# Altium schematic sheet 60_HOST_UART.SchDoc
size 209 x 148 mm
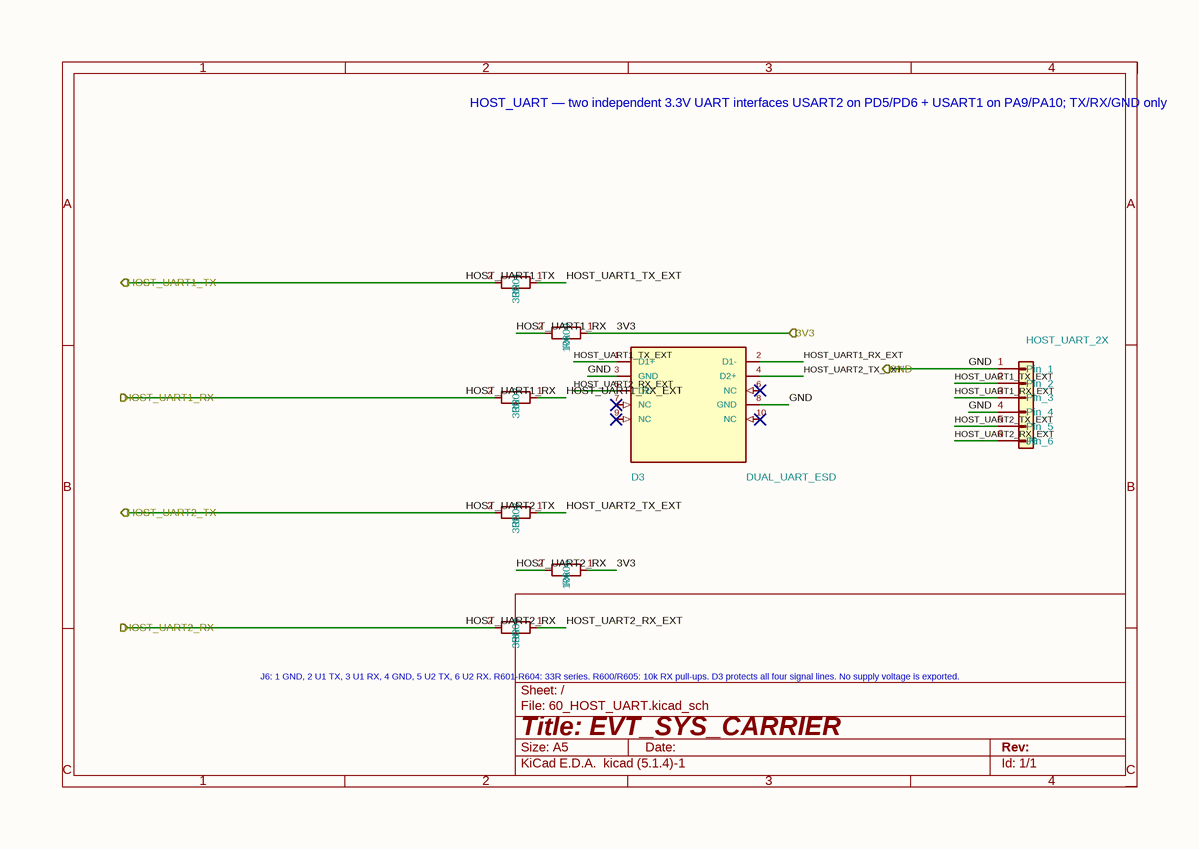
[diagram p0: 60_HOST_UART.SchDoc]

## Parts
D3  DUAL_UART_ESD  [USON-10_2.5x1.0mm_P0.5mm]
J6  HOST_UART_2X  [Molex_43045-0600_RA_THT_6P]
R600  10k  [R_0603_1608Metric]
R601  33R  [R_0402_1005Metric]
R602  33R  [R_0402_1005Metric]
R603  33R  [R_0402_1005Metric]
R604  33R  [R_0402_1005Metric]
R605  10k  [R_0603_1608Metric]

## Ports
3V3 (in), GND, HOST_UART1_RX (out), HOST_UART1_TX (in), HOST_UART2_RX (out), HOST_UART2_TX (in)

## Nets
3V3: R600.1 R605.1 ; port 3V3
GND: D3.3(GND) D3.8(GND) J6.1(Pin_1) J6.4(Pin_4) ; port GND
HOST_UART1_RX: R600.2 R602.2 ; port HOST_UART1_RX
HOST_UART1_RX_EXT: D3.2(D1-) J6.3(Pin_3) R602.1
HOST_UART1_TX: R601.2 ; port HOST_UART1_TX
HOST_UART1_TX_EXT: D3.1(D1+) J6.2(Pin_2) R601.1
HOST_UART2_RX: R604.2 R605.2 ; port HOST_UART2_RX
HOST_UART2_RX_EXT: D3.5(D2-) J6.6(Pin_6) R604.1
HOST_UART2_TX: R603.2 ; port HOST_UART2_TX
HOST_UART2_TX_EXT: D3.4(D2+) J6.5(Pin_5) R603.1

Not connected (* = marked no-connect by the designer): D3 6(NC)* 7(NC)* 9(NC)* 10(NC)*

## Notes on the sheet
- HOST_UART — two independent 3.3V UART interfaces
  USART2 on PD5/PD6 + USART1 on PA9/PA10; TX/RX/GND only
- (near R604) J6: 1 GND, 2 U1 TX, 3 U1 RX,
  4 GND, 5 U2 TX, 6 U2 RX.
  R601-R604: 33R series. R600/R605: 10k RX pull-ups.
  D3 protects all four signal lines.
  No supply voltage is exported.
- 1
- 2
- 3
- 4
- A
- B
- Title: EVT_SYS_CARRIER
- File: 60_HOST_UART.kicad_sch
- Sheet: /
- C
- KiCad E.D.A.  kicad (5.1.4)-1
- Size: A5
- Date:
- Rev:
- Id: 1/1

## Library data of the parts
D3 = TPD4E05U06DQAR: Capture_Status: LOCAL_CONTRACT_SYMBOL; hierarchy_path: /9ce958f3-6019-45fe-bc02-0cccce48adf8/2832ddd1-de9d-48ab-8137-5ba09d30c47d; MPN: TPD4E05U06DQAR; Value: DUAL_UART_ESD; Footprint: Package_SON:USON-10_2.5x1.0mm_P0.5mm
J6 = Conn_01x06: MPN: 43045-0600; hierarchy_path: /9ce958f3-6019-45fe-bc02-0cccce48adf8/2832ddd1-de9d-48ab-8137-5ba09d30c47d; Value: HOST_UART_2X; Footprint: SystemCarrier_Altium:Molex_43045-0600_RA_THT_6P
R600 R605 = R: MPN: 10k_1%; hierarchy_path: /9ce958f3-6019-45fe-bc02-0cccce48adf8/2832ddd1-de9d-48ab-8137-5ba09d30c47d; Value: 10k; Footprint: Resistor_SMD:R_0603_1608Metric
R601-R604 = R: MPN: 33R_1%; hierarchy_path: /9ce958f3-6019-45fe-bc02-0cccce48adf8/2832ddd1-de9d-48ab-8137-5ba09d30c47d; Value: 33R; Footprint: Resistor_SMD:R_0402_1005Metric